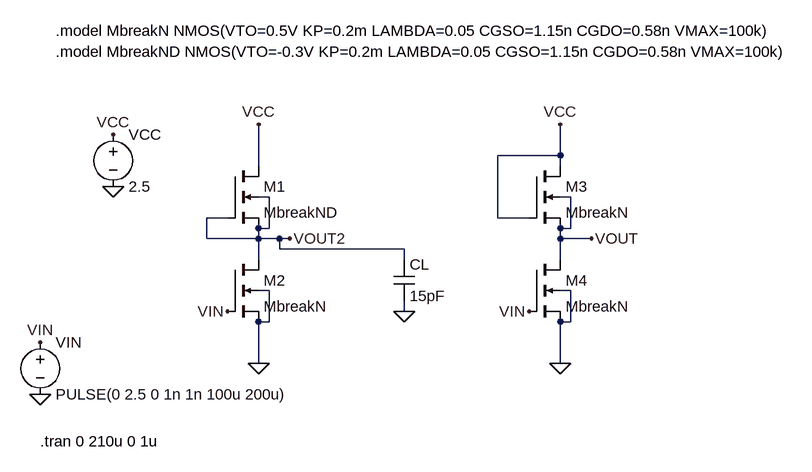
[diagram p0: schematic I_4.asc]
I_4.asc, the LTspice schematic file:
Version 4.1
SHEET 1 1412 856
WIRE 784 96 784 48
WIRE 784 96 688 96
WIRE 320 112 320 48
WIRE 784 112 784 96
WIRE 336 160 320 160
WIRE 800 160 784 160
WIRE 272 192 240 192
WIRE 688 192 688 96
WIRE 736 192 688 192
WIRE 336 208 336 160
WIRE 336 208 320 208
WIRE 800 208 800 160
WIRE 800 208 784 208
WIRE 240 224 240 192
WIRE 320 224 320 208
WIRE 320 224 240 224
WIRE 352 224 320 224
WIRE 368 224 352 224
WIRE 784 224 784 208
WIRE 832 224 784 224
WIRE 352 240 352 224
WIRE 544 240 352 240
WIRE 320 256 320 224
WIRE 544 256 544 240
WIRE 784 256 784 224
WIRE 336 304 320 304
WIRE 800 304 784 304
WIRE 544 336 544 320
WIRE 336 352 336 304
WIRE 336 352 320 352
WIRE 800 352 800 304
WIRE 800 352 784 352
WIRE 320 416 320 352
WIRE 784 416 784 352
FLAG 320 416 0
FLAG 96 144 0
FLAG 96 64 VCC
FLAG 320 48 VCC
FLAG -16 464 0
FLAG -16 384 VIN
FLAG 272 336 VIN
FLAG 368 224 VOUT2
FLAG 784 416 0
FLAG 784 48 VCC
FLAG 736 336 VIN
FLAG 832 224 VOUT
FLAG 544 336 0
SYMBOL voltage 96 48 R0
WINDOW 123 0 0 Left 0
WINDOW 39 0 0 Left 0
SYMATTR InstName VCC
SYMATTR Value 2.5
SYMBOL voltage -16 368 R0
WINDOW 123 0 0 Left 0
WINDOW 39 0 0 Left 0
SYMATTR InstName VIN
SYMATTR Value PULSE(0 2.5 0 1n 1n 100u 200u)
SYMBOL cap 528 256 R0
SYMATTR InstName CL
SYMATTR Value 15pF
SYMBOL nmos4 272 112 R0
SYMATTR InstName M1
SYMATTR Value MbreakND
SYMATTR Value2 l=2u w=0.5u
SYMBOL nmos4 272 256 R0
SYMATTR InstName M2
SYMATTR Value MbreakN
SYMATTR Value2 l=1.5u w=0.5u
SYMBOL nmos4 736 112 R0
SYMATTR InstName M3
SYMATTR Value MbreakN
SYMATTR Value2 l=0.5u w=1.5u
SYMBOL nmos4 736 256 R0
SYMATTR InstName M4
SYMATTR Value MbreakN
SYMATTR Value2 l=0.5u w=1.5u
TEXT 8 -96 Left 2 !.model MbreakN NMOS(VTO=0.5V KP=0.2m LAMBDA=0.05 CGSO=1.15n CGDO=0.58n VMAX=100k)
TEXT 8 -64 Left 2 !.model MbreakND NMOS(VTO=-0.3V KP=0.2m LAMBDA=0.05 CGSO=1.15n CGDO=0.58n VMAX=100k)
TEXT -16 536 Left 2 !.tran 0 210u 0 1u

The netlist it stands for:
* I_4.asc
VCC VCC 0 2.5
VIN VIN 0 PULSE(0 2.5 0 1n 1n 100u 200u)
CL VOUT2 0 15pF
M1 VCC VOUT2 VOUT2 VOUT2 MbreakND l=2u w=0.5u
M2 VOUT2 VIN 0 0 MbreakN l=1.5u w=0.5u
M3 VCC VCC VOUT VOUT MbreakN l=0.5u w=1.5u
M4 VOUT VIN 0 0 MbreakN l=0.5u w=1.5u
.model NMOS NMOS
.model PMOS PMOS
.lib standard.mos
.model MbreakN NMOS(VTO=0.5V KP=0.2m LAMBDA=0.05 CGSO=1.15n CGDO=0.58n VMAX=100k)
.model MbreakND NMOS(VTO=-0.3V KP=0.2m LAMBDA=0.05 CGSO=1.15n CGDO=0.58n VMAX=100k)
.tran 0 210u 0 1u
.backanno
.end